# Altium schematic sheet 02.C212. A01-A12. Module BASU Turret Horizontal aiming encoder .SchDoc: Кабель энкодера ГН
size 209 x 297 mm; Author: Мурашкин Д.В.; Address1: Address1; Address2: Address2; Address3: Address3; Address4: Address4; DocumentNumber: ИЗДЕЛИЕ-1-2; SheetNumber: 24; Scale: 1:1; Letter1Column: Э
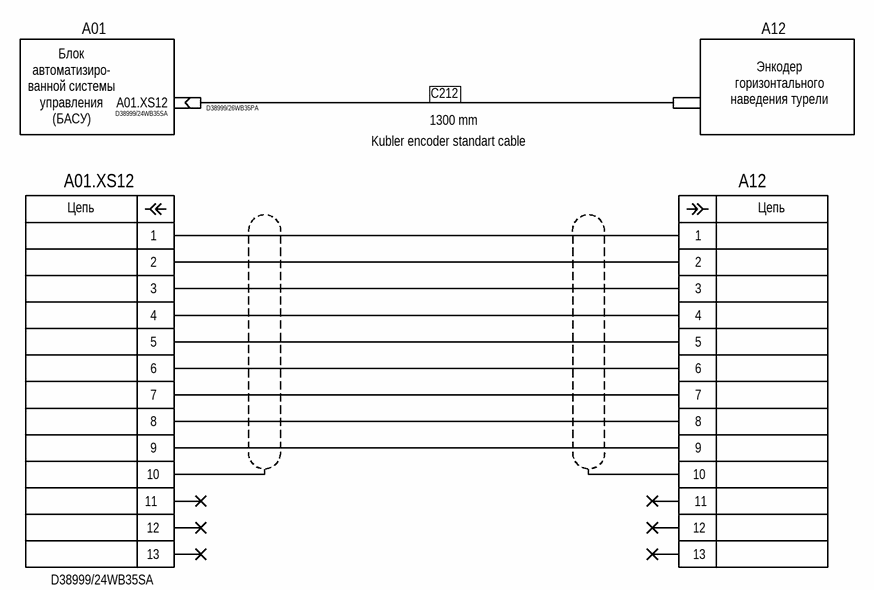
[diagram p0: 02.C212. A01-A12. Module BASU Turret Horizontal aiming encoder .SchDoc]

## Parts
(Parts that share a designator on the sheet are numbered #1, #2 ... from top to bottom, then left to right.)
A01.XS12#1  D38999/24WB35SA
A01.XS12#2  D38999/24WB35SA
A12  (no value)
A?#1  D38999/26WB35PA
A?#2  Провод  (value not drawn)  (no BOM)

## Nets
С212: A?#1.0 A?#2.0
NetA01.XS12#2_1: A01.XS12#2.1 A12.1
NetA01.XS12#2_2: A01.XS12#2.2 A12.2
NetA01.XS12#2_3: A01.XS12#2.3 A12.3
NetA01.XS12#2_4: A01.XS12#2.4 A12.4
NetA01.XS12#2_5: A01.XS12#2.5 A12.5
NetA01.XS12#2_6: A01.XS12#2.6 A12.6
NetA01.XS12#2_7: A01.XS12#2.7 A12.7
NetA01.XS12#2_8: A01.XS12#2.8 A12.8
NetA01.XS12#2_9: A01.XS12#2.9 A12.9

Not connected (* = marked no-connect by the designer): A01.XS12#1 0; A01.XS12#2 10 11* 12* 13*; A12 10 11* 12* 13*

## Notes on the sheet
- A01
- A12
- (near A?#2) Энкодер горизонтального наведения турели
- Блок автоматизиро- ванной системы управления (БАСУ)
- Kubler encoder standart cable
- 1300 mm
- Перв. примен.
- Справ. №
- Подп. и дата
- Инв. № дубл.
- Взам. инв. №
- Инв. № подл.
- Изм.
- Лист
- № докум.
- Подп.
- Дата
- 2.106-A4
- Копировал
- Формат А4
- (in symbol Connector signal P13) Цепь

## Library data of the parts
A01.XS12#1 = Connector cable socket: Part name: D38999/24WB35SA; Operating temperature: -°C +°C; Mounting type: Surface mount; Dimension: .0mm x .0mm; Height: .0mm
A01.XS12#2 A12 = Connector signal P13: P13 MIL; Operating temperature: -°C +°C; Mounting type: Surface mount; Dimension: .0mm x .0mm; Height: .0mm
A?#1 = Connector cable plug: Part name: D38999/26WB35PA; Operating temperature: -°C +°C; Mounting type: Surface mount; Dimension: .0mm x .0mm; Height: .0mm
A?#2 = Connector cable coupling: Operating temperature: -°C +°C; Mounting type: Surface mount; Dimension: .0mm x .0mm; Height: .0mm